# Altium schematic sheet 08_KOM_ACB23_4009_Connectors.SchDoc: Connectors
size A4; DocumentNumber: 2023-03-28; Revision: v0.11; SheetNumber: 8; SheetTotal: 9
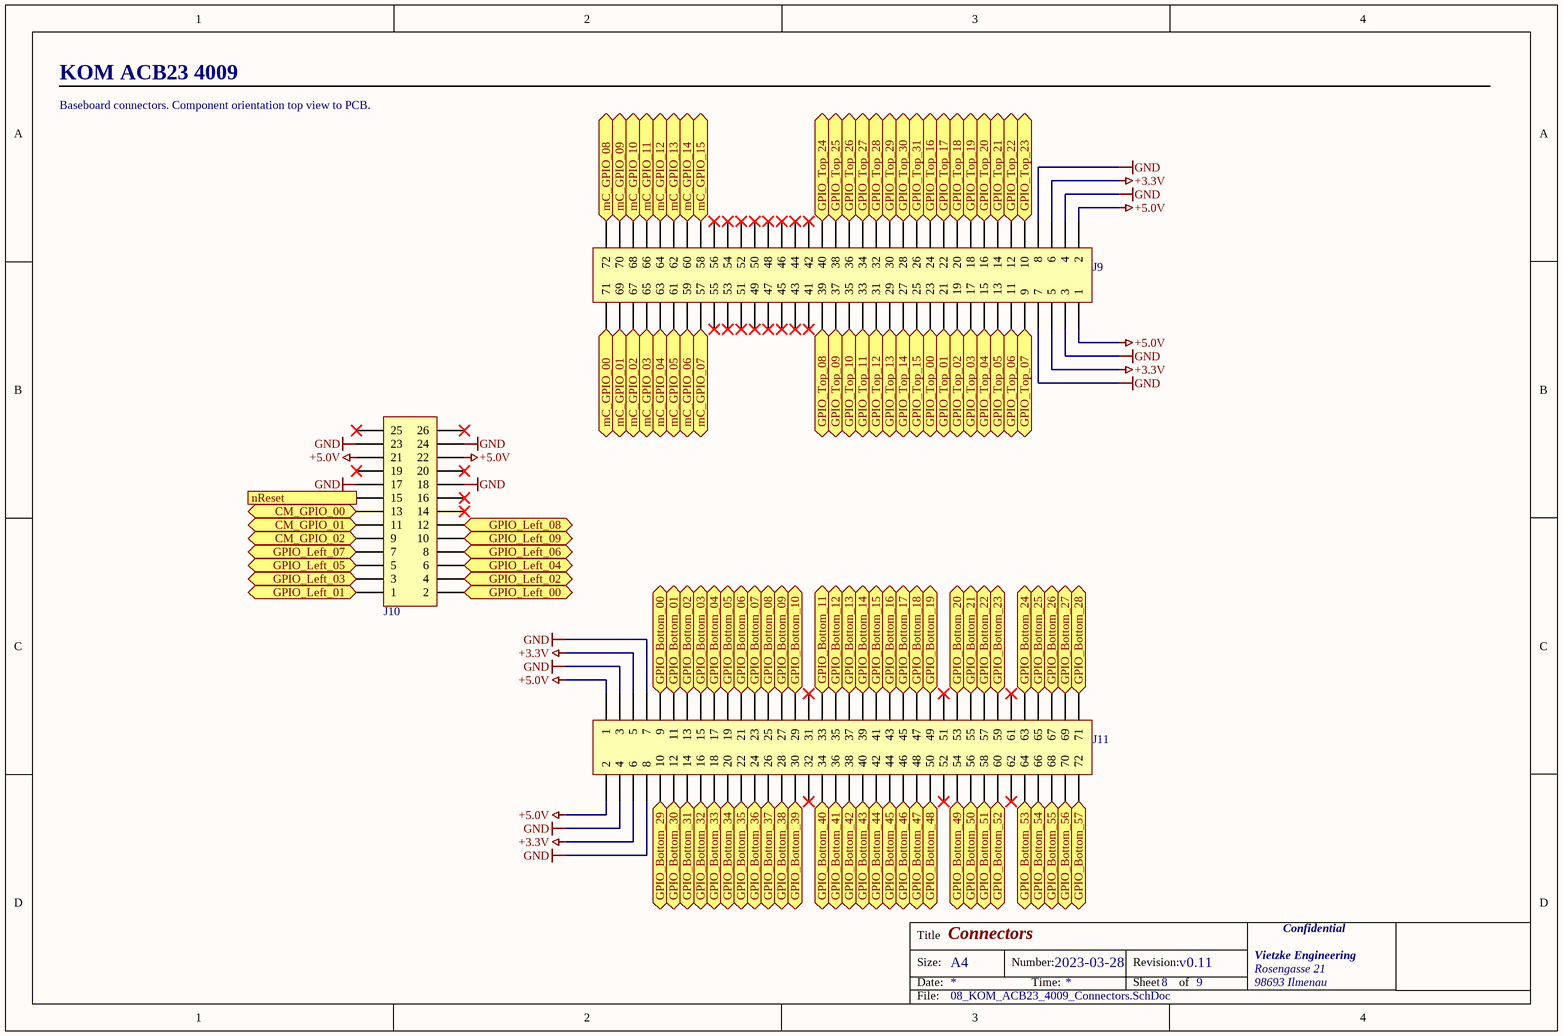
[diagram p0: 08_KOM_ACB23_4009_Connectors.SchDoc]

## Parts
J9  77313-424-72LF  [Pinheader 02x36]  (value not drawn)
J10  75844-127-26LF  [Pinheader 02x13]  (value not drawn)
J11  77313-424-72LF  [Pinheader 02x36]  (value not drawn)

## Ports
CM_GPIO_00 (bidir), CM_GPIO_01 (bidir), CM_GPIO_02 (bidir), GPIO_Bottom_00 (bidir), GPIO_Bottom_01 (bidir), GPIO_Bottom_02 (bidir), GPIO_Bottom_03 (bidir), GPIO_Bottom_04 (bidir), GPIO_Bottom_05 (bidir), GPIO_Bottom_06 (bidir), GPIO_Bottom_07 (bidir), GPIO_Bottom_08 (bidir), GPIO_Bottom_09 (bidir), GPIO_Bottom_10 (bidir), GPIO_Bottom_11 (bidir), GPIO_Bottom_12 (bidir), GPIO_Bottom_13 (bidir), GPIO_Bottom_14 (bidir), GPIO_Bottom_15 (bidir), GPIO_Bottom_16 (bidir), GPIO_Bottom_17 (bidir), GPIO_Bottom_18 (bidir), GPIO_Bottom_19 (bidir), GPIO_Bottom_20 (bidir), GPIO_Bottom_21 (bidir), GPIO_Bottom_22 (bidir), GPIO_Bottom_23 (bidir), GPIO_Bottom_24 (bidir), GPIO_Bottom_25 (bidir), GPIO_Bottom_26 (bidir), GPIO_Bottom_27 (bidir), GPIO_Bottom_28 (bidir), GPIO_Bottom_29 (bidir), GPIO_Bottom_30 (bidir), GPIO_Bottom_31 (bidir), GPIO_Bottom_32 (bidir), GPIO_Bottom_33 (bidir), GPIO_Bottom_34 (bidir), GPIO_Bottom_35 (bidir), GPIO_Bottom_36 (bidir), GPIO_Bottom_37 (bidir), GPIO_Bottom_38 (bidir), GPIO_Bottom_39 (bidir), GPIO_Bottom_40 (bidir), GPIO_Bottom_41 (bidir), GPIO_Bottom_42 (bidir), GPIO_Bottom_43 (bidir), GPIO_Bottom_44 (bidir), GPIO_Bottom_45 (bidir), GPIO_Bottom_46 (bidir), GPIO_Bottom_47 (bidir), GPIO_Bottom_48 (bidir), GPIO_Bottom_49 (bidir), GPIO_Bottom_50 (bidir), GPIO_Bottom_51 (bidir), GPIO_Bottom_52 (bidir), GPIO_Bottom_53 (bidir), GPIO_Bottom_54 (bidir), GPIO_Bottom_55 (bidir), GPIO_Bottom_56 (bidir), GPIO_Bottom_57 (bidir), GPIO_Left_00 (bidir), GPIO_Left_01 (bidir), GPIO_Left_02 (bidir), GPIO_Left_03 (bidir), GPIO_Left_04 (bidir), GPIO_Left_05 (bidir), GPIO_Left_06 (bidir), GPIO_Left_07 (bidir), GPIO_Left_08 (bidir), GPIO_Left_09 (bidir), GPIO_Top_00 (bidir), GPIO_Top_01 (bidir), GPIO_Top_02 (bidir), GPIO_Top_03 (bidir), GPIO_Top_04 (bidir), GPIO_Top_05 (bidir), GPIO_Top_06 (bidir), GPIO_Top_07 (bidir), GPIO_Top_08 (bidir), GPIO_Top_09 (bidir), GPIO_Top_10 (bidir), GPIO_Top_11 (bidir), GPIO_Top_12 (bidir), GPIO_Top_13 (bidir), GPIO_Top_14 (bidir), GPIO_Top_15 (bidir), GPIO_Top_16 (bidir), GPIO_Top_17 (bidir), GPIO_Top_18 (bidir), GPIO_Top_19 (bidir), GPIO_Top_20 (bidir), GPIO_Top_21 (bidir), GPIO_Top_22 (bidir), GPIO_Top_23 (bidir), GPIO_Top_24 (bidir), GPIO_Top_25 (bidir), GPIO_Top_26 (bidir), GPIO_Top_27 (bidir), GPIO_Top_28 (bidir), GPIO_Top_29 (bidir), GPIO_Top_30 (bidir), GPIO_Top_31 (bidir), mC_GPIO_00 (bidir), mC_GPIO_01 (bidir), mC_GPIO_02 (bidir), mC_GPIO_03 (bidir), mC_GPIO_04 (bidir), mC_GPIO_05 (bidir), mC_GPIO_06 (bidir), mC_GPIO_07 (bidir), mC_GPIO_08 (bidir), mC_GPIO_09 (bidir), mC_GPIO_10 (bidir), mC_GPIO_11 (bidir), mC_GPIO_12 (bidir), mC_GPIO_13 (bidir), mC_GPIO_14 (bidir), mC_GPIO_15 (bidir), nReset (in)

## Nets
+3.3V: J9.5 J9.6 J11.5 J11.6
+5.0V: J9.1 J9.2 J10.21 J10.22 J11.1 J11.2
GND: J9.3 J9.4 J9.7 J9.8 J10.17 J10.18 J10.23 J10.24 J11.3 J11.4 J11.7 J11.8
CM_GPIO_00: J10.13 ; port CM_GPIO_00
CM_GPIO_01: J10.11 ; port CM_GPIO_01
CM_GPIO_02: J10.9 ; port CM_GPIO_02
GPIO_Bottom_00: J11.9 ; port GPIO_Bottom_00
GPIO_Bottom_01: J11.11 ; port GPIO_Bottom_01
GPIO_Bottom_02: J11.13 ; port GPIO_Bottom_02
GPIO_Bottom_03: J11.15 ; port GPIO_Bottom_03
GPIO_Bottom_04: J11.17 ; port GPIO_Bottom_04
GPIO_Bottom_05: J11.19 ; port GPIO_Bottom_05
GPIO_Bottom_06: J11.21 ; port GPIO_Bottom_06
GPIO_Bottom_07: J11.23 ; port GPIO_Bottom_07
GPIO_Bottom_08: J11.25 ; port GPIO_Bottom_08
GPIO_Bottom_09: J11.27 ; port GPIO_Bottom_09
GPIO_Bottom_10: J11.29 ; port GPIO_Bottom_10
GPIO_Bottom_11: J11.33 ; port GPIO_Bottom_11
GPIO_Bottom_12: J11.35 ; port GPIO_Bottom_12
GPIO_Bottom_13: J11.37 ; port GPIO_Bottom_13
GPIO_Bottom_14: J11.39 ; port GPIO_Bottom_14
GPIO_Bottom_15: J11.41 ; port GPIO_Bottom_15
GPIO_Bottom_16: J11.43 ; port GPIO_Bottom_16
GPIO_Bottom_17: J11.45 ; port GPIO_Bottom_17
GPIO_Bottom_18: J11.47 ; port GPIO_Bottom_18
GPIO_Bottom_19: J11.49 ; port GPIO_Bottom_19
GPIO_Bottom_20: J11.53 ; port GPIO_Bottom_20
GPIO_Bottom_21: J11.55 ; port GPIO_Bottom_21
GPIO_Bottom_22: J11.57 ; port GPIO_Bottom_22
GPIO_Bottom_23: J11.59 ; port GPIO_Bottom_23
GPIO_Bottom_24: J11.63 ; port GPIO_Bottom_24
GPIO_Bottom_25: J11.65 ; port GPIO_Bottom_25
GPIO_Bottom_26: J11.67 ; port GPIO_Bottom_26
GPIO_Bottom_27: J11.69 ; port GPIO_Bottom_27
GPIO_Bottom_28: J11.71 ; port GPIO_Bottom_28
GPIO_Bottom_29: J11.10 ; port GPIO_Bottom_29
GPIO_Bottom_30: J11.12 ; port GPIO_Bottom_30
GPIO_Bottom_31: J11.14 ; port GPIO_Bottom_31
GPIO_Bottom_32: J11.16 ; port GPIO_Bottom_32
GPIO_Bottom_33: J11.18 ; port GPIO_Bottom_33
GPIO_Bottom_34: J11.20 ; port GPIO_Bottom_34
GPIO_Bottom_35: J11.22 ; port GPIO_Bottom_35
GPIO_Bottom_36: J11.24 ; port GPIO_Bottom_36
GPIO_Bottom_37: J11.26 ; port GPIO_Bottom_37
GPIO_Bottom_38: J11.28 ; port GPIO_Bottom_38
GPIO_Bottom_39: J11.30 ; port GPIO_Bottom_39
GPIO_Bottom_40: J11.34 ; port GPIO_Bottom_40
GPIO_Bottom_41: J11.36 ; port GPIO_Bottom_41
GPIO_Bottom_42: J11.38 ; port GPIO_Bottom_42
GPIO_Bottom_43: J11.40 ; port GPIO_Bottom_43
GPIO_Bottom_44: J11.42 ; port GPIO_Bottom_44
GPIO_Bottom_45: J11.44 ; port GPIO_Bottom_45
GPIO_Bottom_46: J11.46 ; port GPIO_Bottom_46
GPIO_Bottom_47: J11.48 ; port GPIO_Bottom_47
GPIO_Bottom_48: J11.50 ; port GPIO_Bottom_48
GPIO_Bottom_49: J11.54 ; port GPIO_Bottom_49
GPIO_Bottom_50: J11.56 ; port GPIO_Bottom_50
GPIO_Bottom_51: J11.58 ; port GPIO_Bottom_51
GPIO_Bottom_52: J11.60 ; port GPIO_Bottom_52
GPIO_Bottom_53: J11.64 ; port GPIO_Bottom_53
GPIO_Bottom_54: J11.66 ; port GPIO_Bottom_54
GPIO_Bottom_55: J11.68 ; port GPIO_Bottom_55
GPIO_Bottom_56: J11.70 ; port GPIO_Bottom_56
GPIO_Bottom_57: J11.72 ; port GPIO_Bottom_57
GPIO_Left_00: J10.2 ; port GPIO_Left_00
GPIO_Left_01: J10.1 ; port GPIO_Left_01
GPIO_Left_02: J10.4 ; port GPIO_Left_02
GPIO_Left_03: J10.3 ; port GPIO_Left_03
GPIO_Left_04: J10.6 ; port GPIO_Left_04
GPIO_Left_05: J10.5 ; port GPIO_Left_05
GPIO_Left_06: J10.8 ; port GPIO_Left_06
GPIO_Left_07: J10.7 ; port GPIO_Left_07
GPIO_Left_08: J10.12 ; port GPIO_Left_08
GPIO_Left_09: J10.10 ; port GPIO_Left_09
GPIO_Top_00: J9.23 ; port GPIO_Top_00
GPIO_Top_01: J9.21 ; port GPIO_Top_01
GPIO_Top_02: J9.19 ; port GPIO_Top_02
GPIO_Top_03: J9.17 ; port GPIO_Top_03
GPIO_Top_04: J9.15 ; port GPIO_Top_04
GPIO_Top_05: J9.13 ; port GPIO_Top_05
GPIO_Top_06: J9.11 ; port GPIO_Top_06
GPIO_Top_07: J9.9 ; port GPIO_Top_07
GPIO_Top_08: J9.39 ; port GPIO_Top_08
GPIO_Top_09: J9.37 ; port GPIO_Top_09
GPIO_Top_10: J9.35 ; port GPIO_Top_10
GPIO_Top_11: J9.33 ; port GPIO_Top_11
GPIO_Top_12: J9.31 ; port GPIO_Top_12
GPIO_Top_13: J9.29 ; port GPIO_Top_13
GPIO_Top_14: J9.27 ; port GPIO_Top_14
GPIO_Top_15: J9.25 ; port GPIO_Top_15
GPIO_Top_16: J9.24 ; port GPIO_Top_16
GPIO_Top_17: J9.22 ; port GPIO_Top_17
GPIO_Top_18: J9.20 ; port GPIO_Top_18
GPIO_Top_19: J9.18 ; port GPIO_Top_19
GPIO_Top_20: J9.16 ; port GPIO_Top_20
GPIO_Top_21: J9.14 ; port GPIO_Top_21
GPIO_Top_22: J9.12 ; port GPIO_Top_22
GPIO_Top_23: J9.10 ; port GPIO_Top_23
GPIO_Top_24: J9.40 ; port GPIO_Top_24
GPIO_Top_25: J9.38 ; port GPIO_Top_25
GPIO_Top_26: J9.36 ; port GPIO_Top_26
GPIO_Top_27: J9.34 ; port GPIO_Top_27
GPIO_Top_28: J9.32 ; port GPIO_Top_28
GPIO_Top_29: J9.30 ; port GPIO_Top_29
GPIO_Top_30: J9.28 ; port GPIO_Top_30
GPIO_Top_31: J9.26 ; port GPIO_Top_31
mC_GPIO_00: J9.71 ; port mC_GPIO_00
mC_GPIO_01: J9.69 ; port mC_GPIO_01
mC_GPIO_02: J9.67 ; port mC_GPIO_02
mC_GPIO_03: J9.65 ; port mC_GPIO_03
mC_GPIO_04: J9.63 ; port mC_GPIO_04
mC_GPIO_05: J9.61 ; port mC_GPIO_05
mC_GPIO_06: J9.59 ; port mC_GPIO_06
mC_GPIO_07: J9.57 ; port mC_GPIO_07
mC_GPIO_08: J9.72 ; port mC_GPIO_08
mC_GPIO_09: J9.70 ; port mC_GPIO_09
mC_GPIO_10: J9.68 ; port mC_GPIO_10
mC_GPIO_11: J9.66 ; port mC_GPIO_11
mC_GPIO_12: J9.64 ; port mC_GPIO_12
mC_GPIO_13: J9.62 ; port mC_GPIO_13
mC_GPIO_14: J9.60 ; port mC_GPIO_14
mC_GPIO_15: J9.58 ; port mC_GPIO_15
nReset: J10.15 ; port nReset

Not connected (* = marked no-connect by the designer): J9 41* 42* 43* 44* 45* 46* 47* 48* 49* 50* 51* 52* 53* 54* 55* 56*; J10 14* 16* 19* 20* 25* 26*; J11 31* 32* 51* 52* 61* 62*

## Notes on the sheet
- KOM ACB23 4009
- Baseboard connectors. Component orientation top view to PCB.
- Title
- Size:
- Date:
- A4
- Number:
- Time:
- Revision:
- Sheet
- of
- Vietzke Engineering
- Rosengasse 21
- 98693 Ilmenau
- Confidential
- File:

## Library data of the parts
J9 J11 = 77313-424-72LF: Pinheader 02x36 Male THT; Type: THT; Package: -; Supplier 1: Mouser; Supplier Part Number 1: 649-77313-424-72LF
J10 = 75844-127-26LF: Pinheader 02x13 Male THT; Type: THT; Package: -; Supplier 1: Mouser; Supplier Part Number 1: 649-75844-127-26LF